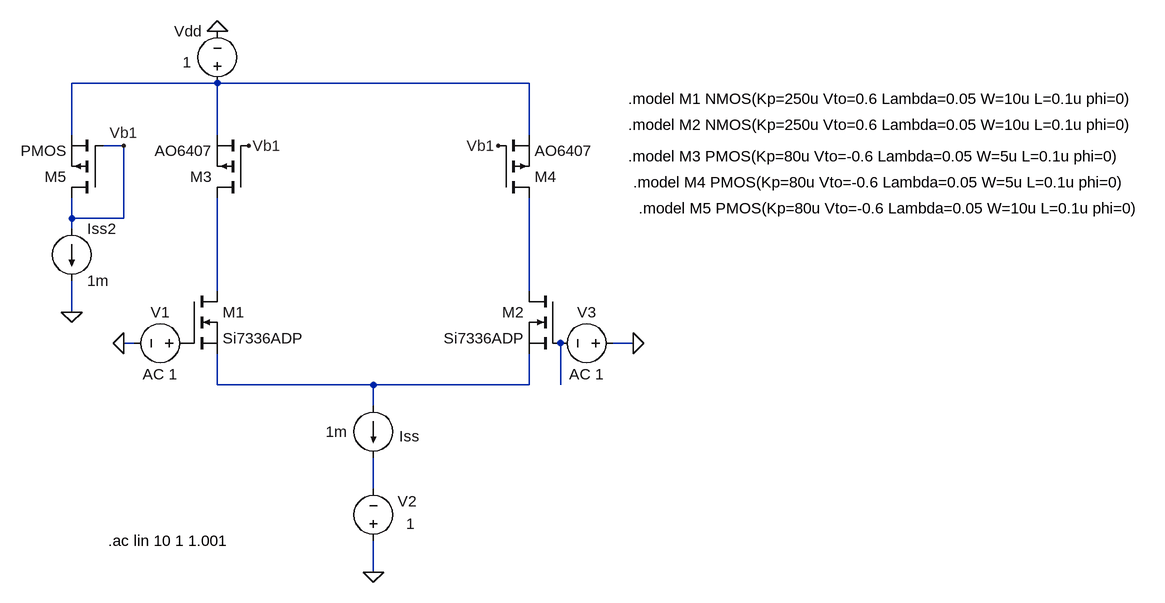
[diagram p0: schematic 3.asc]
3.asc, the LTspice schematic file:
Version 4
SHEET 1 1736 776
WIRE 240 -144 16 -144
WIRE 720 -144 240 -144
WIRE 16 -64 16 -144
WIRE 240 -64 240 -144
WIRE 720 -64 720 -144
WIRE 96 -48 64 -48
WIRE 16 64 16 32
WIRE 96 64 96 -48
WIRE 96 64 16 64
WIRE 16 80 16 64
WIRE 240 176 240 32
WIRE 720 176 720 32
WIRE 16 208 16 160
WIRE 112 256 96 256
WIRE 880 256 848 256
WIRE 240 320 240 272
WIRE 480 320 240 320
WIRE 720 320 720 272
WIRE 720 320 480 320
WIRE 768 320 768 256
WIRE 480 352 480 320
WIRE 480 480 480 432
WIRE 480 608 480 560
FLAG 288 -48 Vb1
FLAG 672 -48 Vb1
FLAG 480 608 0
FLAG 880 256 0
FLAG 96 -48 Vb1
FLAG 16 208 0
FLAG 240 -224 0
FLAG 96 256 0
SYMBOL nmos 192 176 R0
SYMATTR InstName M1
SYMATTR Value Si7336ADP
SYMBOL nmos 768 176 M0
SYMATTR InstName M2
SYMATTR Value Si7336ADP
SYMBOL pmos 288 32 R180
SYMATTR InstName M3
SYMATTR Value AO6407
SYMBOL pmos 672 32 M180
SYMATTR InstName M4
SYMATTR Value AO6407
SYMBOL current 480 352 R0
WINDOW 0 40 47 Left 2
WINDOW 3 -73 40 Left 2
SYMATTR InstName Iss
SYMATTR Value 1m
SYMBOL voltage 480 576 R180
WINDOW 0 -67 77 Left 2
WINDOW 3 -64 42 Left 2
WINDOW 123 0 0 Left 0
WINDOW 39 0 0 Left 0
SYMATTR InstName V2
SYMATTR Value 1
SYMBOL pmos 64 32 R180
SYMATTR InstName M5
SYMBOL current 16 80 R0
WINDOW 123 0 0 Left 0
WINDOW 39 0 0 Left 0
SYMATTR InstName Iss2
SYMATTR Value 1m
SYMBOL voltage 240 -128 R180
WINDOW 0 24 96 Left 2
WINDOW 3 40 48 Left 2
WINDOW 123 0 0 Left 0
WINDOW 39 0 0 Left 0
SYMATTR InstName Vdd
SYMATTR Value 1
SYMBOL voltage 208 256 R90
WINDOW 0 -32 56 VBottom 2
WINDOW 3 32 56 VTop 2
WINDOW 123 0 0 Left 0
WINDOW 39 0 0 Left 0
SYMATTR InstName V1
SYMATTR Value AC 1
SYMBOL voltage 864 256 R90
WINDOW 0 -32 56 VBottom 2
WINDOW 3 32 56 VTop 2
SYMATTR InstName V3
SYMATTR Value AC 1
TEXT 872 -120 Left 2 !.model M1 NMOS(Kp=250u Vto=0.6 Lambda=0.05 W=10u L=0.1u phi=0)
TEXT 872 -80 Left 2 !.model M2 NMOS(Kp=250u Vto=0.6 Lambda=0.05 W=10u L=0.1u phi=0)
TEXT 872 -32 Left 2 !.model M3 PMOS(Kp=80u Vto=-0.6 Lambda=0.05 W=5u L=0.1u phi=0)
TEXT 880 8 Left 2 !.model M4 PMOS(Kp=80u Vto=-0.6 Lambda=0.05 W=5u L=0.1u phi=0)
TEXT 72 560 Left 2 !.ac lin 10 1 1.001
TEXT 888 48 Left 2 !.model M5 PMOS(Kp=80u Vto=-0.6 Lambda=0.05 W=10u L=0.1u phi=0)

The netlist it stands for:
* 3.asc
M1 N002 P001 N004 N004 Si7336ADP
M2 N003 N005 N004 N004 Si7336ADP
M3 N002 Vb1 N001 N001 AO6407
M4 N003 Vb1 N001 N001 AO6407
Iss N004 N006 1m
V2 0 N006 1
M5 Vb1 Vb1 N001 N001 PMOS
Iss2 Vb1 0 1m
Vdd N001 0 1
V1 P001 0 AC 1
V3 0 N005 AC 1
.model NMOS NMOS
.model PMOS PMOS
.lib standard.mos
.model M1 NMOS(Kp=250u Vto=0.6 Lambda=0.05 W=10u L=0.1u phi=0)
.model M2 NMOS(Kp=250u Vto=0.6 Lambda=0.05 W=10u L=0.1u phi=0)
.model M3 PMOS(Kp=80u Vto=-0.6 Lambda=0.05 W=5u L=0.1u phi=0)
.model M4 PMOS(Kp=80u Vto=-0.6 Lambda=0.05 W=5u L=0.1u phi=0)
.ac lin 10 1 1.001
.model M5 PMOS(Kp=80u Vto=-0.6 Lambda=0.05 W=10u L=0.1u phi=0)
.backanno
.end